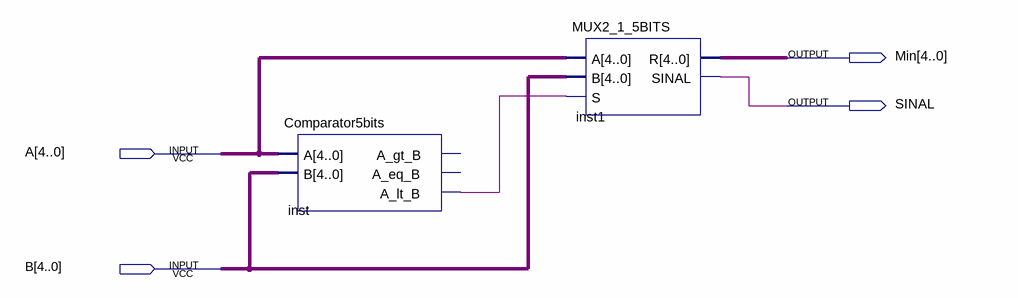
[diagram p0: schematic sheet]
// Quartus schematic Min_5bits.bdf as structural Verilog: 2 symbols, 4 pins
module Min_5bits (
  input  [4:0] A,
  input  [4:0] B,
  output [4:0] Min,
  output SINAL
);

  wire inst_a_lt_b;

  Comparator5bits inst (.A(A), .B(B), .A_lt_B(inst_a_lt_b));  // open: A_gt_B, A_eq_B
  MUX2_1_5BITS inst1 (.A(A), .B(B), .S(inst_a_lt_b), .R(Min), .SINAL(SINAL));
endmodule
